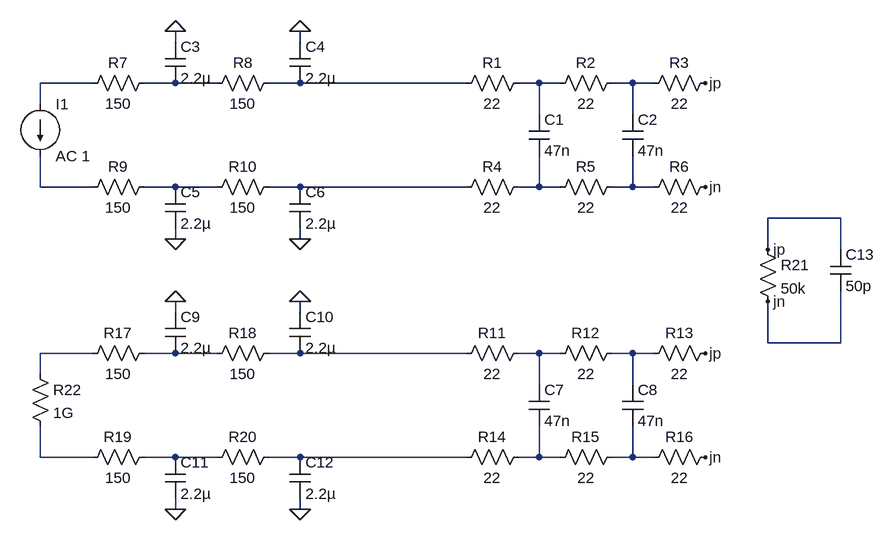
[diagram p0: schematic completo_conRC.asc]
completo_conRC.asc, the LTspice schematic file:
Version 4.1
SHEET 1 1368 680
WIRE -592 -80 -592 -96
WIRE -400 -80 -400 -96
WIRE -720 -16 -800 -16
WIRE -592 -16 -640 -16
WIRE -528 -16 -592 -16
WIRE -400 -16 -448 -16
WIRE -144 -16 -400 -16
WIRE -32 -16 -64 -16
WIRE 0 -16 -32 -16
WIRE 112 -16 80 -16
WIRE 144 -16 112 -16
WIRE -800 16 -800 -16
WIRE -32 32 -32 -16
WIRE 112 32 112 -16
WIRE -800 144 -800 96
WIRE -720 144 -800 144
WIRE -592 144 -640 144
WIRE -528 144 -592 144
WIRE -400 144 -448 144
WIRE -144 144 -400 144
WIRE -32 144 -32 96
WIRE -32 144 -64 144
WIRE 0 144 -32 144
WIRE 112 144 112 96
WIRE 112 144 80 144
WIRE 144 144 112 144
WIRE 432 192 320 192
WIRE -592 224 -592 208
WIRE -400 224 -400 208
WIRE 320 240 320 192
WIRE 432 240 432 192
WIRE -592 336 -592 320
WIRE -400 336 -400 320
WIRE 320 384 320 320
WIRE 432 384 432 304
WIRE 432 384 320 384
WIRE -720 400 -800 400
WIRE -592 400 -640 400
WIRE -528 400 -592 400
WIRE -400 400 -448 400
WIRE -144 400 -400 400
WIRE -32 400 -64 400
WIRE 0 400 -32 400
WIRE 112 400 80 400
WIRE 144 400 112 400
WIRE -800 432 -800 400
WIRE -32 448 -32 400
WIRE 112 448 112 400
WIRE -800 560 -800 512
WIRE -720 560 -800 560
WIRE -592 560 -640 560
WIRE -528 560 -592 560
WIRE -400 560 -448 560
WIRE -144 560 -400 560
WIRE -32 560 -32 512
WIRE -32 560 -64 560
WIRE 0 560 -32 560
WIRE 112 560 112 512
WIRE 112 560 80 560
WIRE 144 560 112 560
WIRE -592 640 -592 624
WIRE -400 640 -400 624
FLAG -592 -96 0
FLAG -400 -96 0
FLAG -592 224 0
FLAG -400 224 0
FLAG -592 320 0
FLAG -400 320 0
FLAG -592 640 0
FLAG -400 640 0
FLAG 224 -16 jp
FLAG 224 400 jp
FLAG 224 144 jn
FLAG 224 560 jn
FLAG 320 240 jp
FLAG 320 320 jn
SYMBOL res -48 -32 R90
WINDOW 0 0 56 VBottom 2
WINDOW 3 32 56 VTop 2
SYMATTR InstName R1
SYMATTR Value 22
SYMBOL res 96 -32 R90
WINDOW 0 0 56 VBottom 2
WINDOW 3 32 56 VTop 2
SYMATTR InstName R2
SYMATTR Value 22
SYMBOL res 240 -32 R90
WINDOW 0 0 56 VBottom 2
WINDOW 3 32 56 VTop 2
SYMATTR InstName R3
SYMATTR Value 22
SYMBOL res -48 128 R90
WINDOW 0 0 56 VBottom 2
WINDOW 3 32 56 VTop 2
SYMATTR InstName R4
SYMATTR Value 22
SYMBOL res 96 128 R90
WINDOW 0 0 56 VBottom 2
WINDOW 3 32 56 VTop 2
SYMATTR InstName R5
SYMATTR Value 22
SYMBOL res 240 128 R90
WINDOW 0 0 56 VBottom 2
WINDOW 3 32 56 VTop 2
SYMATTR InstName R6
SYMATTR Value 22
SYMBOL cap -48 32 R0
SYMATTR InstName C1
SYMATTR Value 47n
SYMBOL cap 96 32 R0
SYMATTR InstName C2
SYMATTR Value 47n
SYMBOL res -48 384 R90
WINDOW 0 0 56 VBottom 2
WINDOW 3 32 56 VTop 2
SYMATTR InstName R11
SYMATTR Value 22
SYMBOL res 96 384 R90
WINDOW 0 0 56 VBottom 2
WINDOW 3 32 56 VTop 2
SYMATTR InstName R12
SYMATTR Value 22
SYMBOL res 240 384 R90
WINDOW 0 0 56 VBottom 2
WINDOW 3 32 56 VTop 2
SYMATTR InstName R13
SYMATTR Value 22
SYMBOL res -48 544 R90
WINDOW 0 0 56 VBottom 2
WINDOW 3 32 56 VTop 2
SYMATTR InstName R14
SYMATTR Value 22
SYMBOL res 96 544 R90
WINDOW 0 0 56 VBottom 2
WINDOW 3 32 56 VTop 2
SYMATTR InstName R15
SYMATTR Value 22
SYMBOL res 240 544 R90
WINDOW 0 0 56 VBottom 2
WINDOW 3 32 56 VTop 2
SYMATTR InstName R16
SYMATTR Value 22
SYMBOL cap -48 448 R0
SYMATTR InstName C7
SYMATTR Value 47n
SYMBOL cap 96 448 R0
SYMATTR InstName C8
SYMATTR Value 47n
SYMBOL res -624 -32 R90
WINDOW 0 0 56 VBottom 2
WINDOW 3 32 56 VTop 2
SYMATTR InstName R7
SYMATTR Value 150
SYMBOL res -432 -32 R90
WINDOW 0 0 56 VBottom 2
WINDOW 3 32 56 VTop 2
SYMATTR InstName R8
SYMATTR Value 150
SYMBOL cap -608 -80 R0
SYMATTR InstName C3
SYMATTR Value 2.2µ
SYMBOL cap -416 -80 R0
SYMATTR InstName C4
SYMATTR Value 2.2µ
SYMBOL res -624 128 R90
WINDOW 0 0 56 VBottom 2
WINDOW 3 32 56 VTop 2
SYMATTR InstName R9
SYMATTR Value 150
SYMBOL res -432 128 R90
WINDOW 0 0 56 VBottom 2
WINDOW 3 32 56 VTop 2
SYMATTR InstName R10
SYMATTR Value 150
SYMBOL cap -608 144 R0
SYMATTR InstName C5
SYMATTR Value 2.2µ
SYMBOL cap -416 144 R0
SYMATTR InstName C6
SYMATTR Value 2.2µ
SYMBOL res -624 384 R90
WINDOW 0 0 56 VBottom 2
WINDOW 3 32 56 VTop 2
SYMATTR InstName R17
SYMATTR Value 150
SYMBOL res -432 384 R90
WINDOW 0 0 56 VBottom 2
WINDOW 3 32 56 VTop 2
SYMATTR InstName R18
SYMATTR Value 150
SYMBOL cap -608 336 R0
SYMATTR InstName C9
SYMATTR Value 2.2µ
SYMBOL cap -416 336 R0
SYMATTR InstName C10
SYMATTR Value 2.2µ
SYMBOL res -624 544 R90
WINDOW 0 0 56 VBottom 2
WINDOW 3 32 56 VTop 2
SYMATTR InstName R19
SYMATTR Value 150
SYMBOL res -432 544 R90
WINDOW 0 0 56 VBottom 2
WINDOW 3 32 56 VTop 2
SYMATTR InstName R20
SYMATTR Value 150
SYMBOL cap -608 560 R0
SYMATTR InstName C11
SYMATTR Value 2.2µ
SYMBOL cap -416 560 R0
SYMATTR InstName C12
SYMATTR Value 2.2µ
SYMBOL res -816 416 R0
SYMATTR InstName R22
SYMATTR Value 1G
SYMBOL res 304 224 R0
SYMATTR InstName R21
SYMATTR Value 50k
SYMBOL cap 416 240 R0
SYMATTR InstName C13
SYMATTR Value 50p
SYMBOL current -800 16 R0
WINDOW 123 0 0 Left 0
WINDOW 39 0 0 Left 0
SYMATTR InstName I1
SYMATTR Value AC 1

The netlist it stands for:
* completo_conRC.asc
R1 N004 N003 22
R2 N005 N004 22
R3 jp N005 22
R4 N009 N008 22
R5 N010 N009 22
R6 jn N010 22
C1 N004 N009 47n
C2 N005 N010 47n
R11 N014 N013 22
R12 N015 N014 22
R13 jp N015 22
R14 N019 N018 22
R15 N020 N019 22
R16 jn N020 22
C7 N014 N019 47n
C8 N015 N020 47n
R7 N002 N001 150
R8 N003 N002 150
C3 0 N002 2.2µ
C4 0 N003 2.2µ
R9 N007 N006 150
R10 N008 N007 150
C5 N007 0 2.2µ
C6 N008 0 2.2µ
R17 N012 N011 150
R18 N013 N012 150
C9 0 N012 2.2µ
C10 0 N013 2.2µ
R19 N017 N016 150
R20 N018 N017 150
C11 N017 0 2.2µ
C12 N018 0 2.2µ
R22 N011 N016 1G
R21 jp jn 50k
C13 jp jn 50p
I1 N001 N006 AC 1
.backanno
.end